# Altium schematic sheet Power.SchDoc
size A3
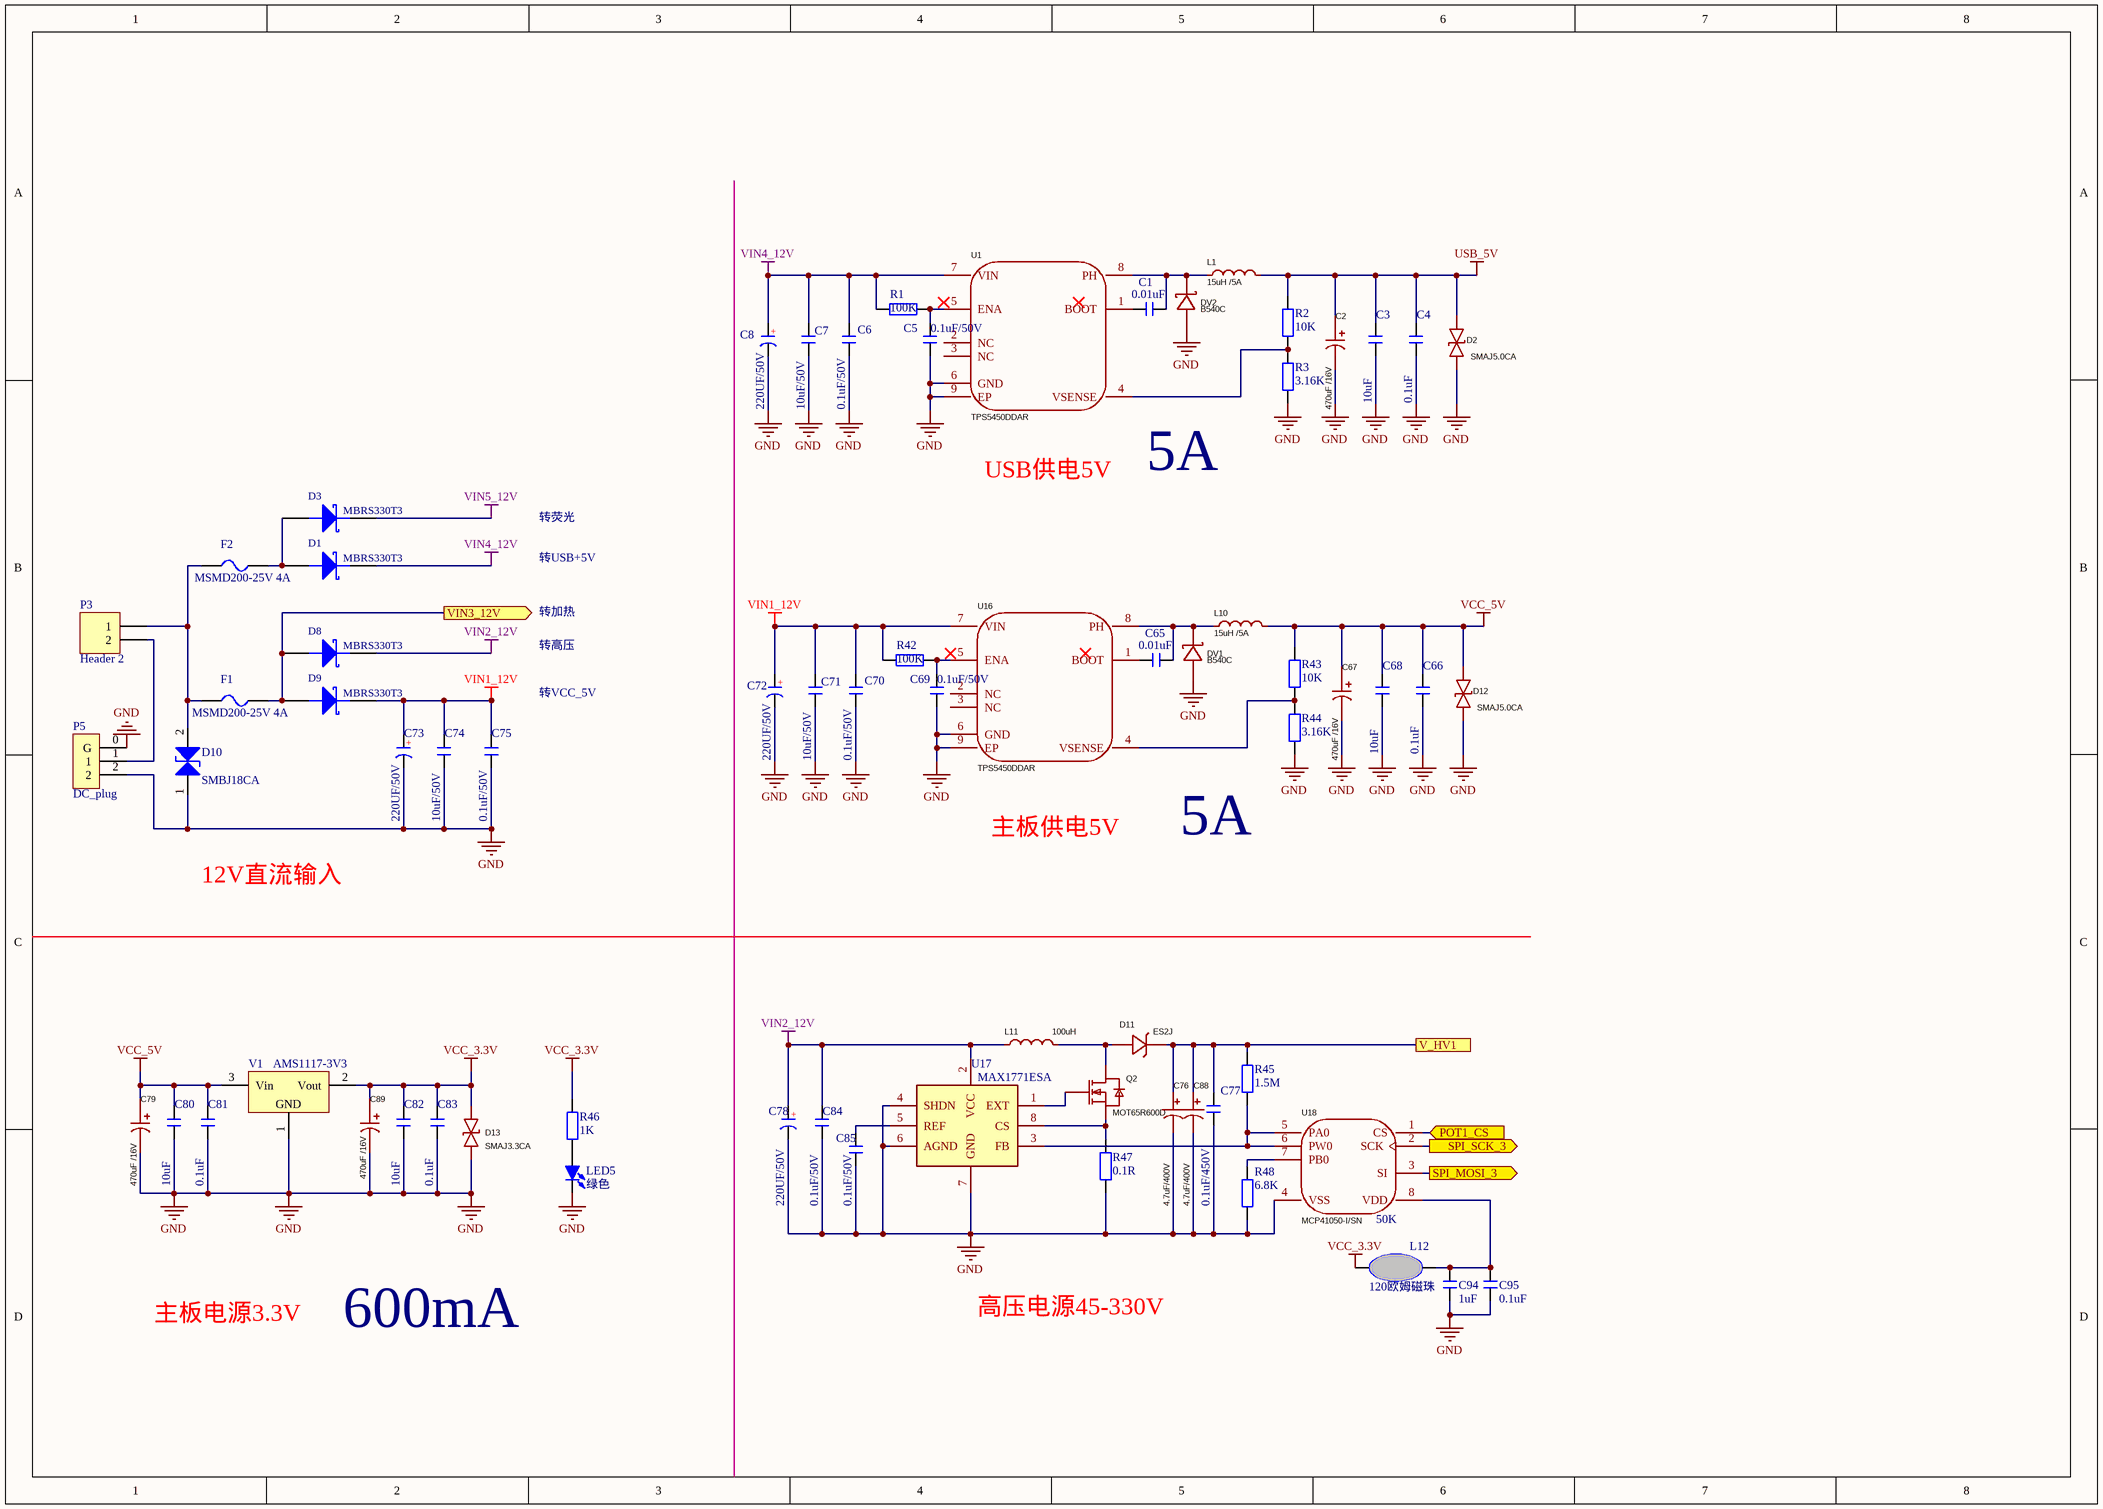
[diagram p0: Power.SchDoc]

## Parts
C1  0.01uF  [C 1206]
C2  470uF /16V  [CAP-TH_BD8.0-P3.50-D0.6-FD]
C3  10uF  [C 0805]
C4  0.1uF  [C 0603]
C5  0.1uF/50V  [C 1206]
C6  0.1uF/50V  [C 1206]
C7  10uF/50V  [C 1206]
C8  220UF/50V  [CAP 5.0*10*12.5]
C65  0.01uF  [C 1206]
C66  0.1uF  [C 0603]
C67  470uF /16V  [CAP-TH_BD8.0-P3.50-D0.6-FD]
C68  10uF  [C 0805]
C69  0.1uF/50V  [C 1206]
C70  0.1uF/50V  [C 1206]
C71  10uF/50V  [C 1206]
C72  220UF/50V  [CAP 5.0*10*12.5]
C73  220UF/50V  [CAP 5.0*10*12.5]
C74  10uF/50V  [C 1206]
C75  0.1uF/50V  [C 1206]
C76  4.7uF/400V  [CAP-TH_BD8.0-P3.50-D0.6-FD]
C77  0.1uF/450V  [C 1206]
C78  220UF/50V  [CAP 5.0*10*12.5]
C79  470uF /16V  [CAP-TH_BD8.0-P3.50-D0.6-FD]
C80  10uF  [C 0805]
C81  0.1uF  [C 0603]
C82  10uF  [C 0805]
C83  0.1uF  [C 0603]
C84  0.1uF/50V  [C 1206]
C85  0.1uF/50V  [C 1206]
C88  4.7uF/400V  [CAP-TH_BD8.0-P3.50-D0.6-FD]
C89  470uF /16V  [CAP-TH_BD8.0-P3.50-D0.6-FD]
C94  1uF  [C 0603]
C95  0.1uF  [C 0603]
D1  MBRS330T3  [MBRS340]
D2  SMAJ5.0CA  [SMA_L4.4-W2.6-LS5.0-BI]
D3  MBRS330T3  [MBRS340]
D8  MBRS330T3  [MBRS340]
D9  MBRS330T3  [MBRS340]
D10  SMBJ18CA  [SMB]
D11  ES2J  [SMB_L4.4-W3.6-LS5.4-RD]
D12  SMAJ5.0CA  [SMA_L4.4-W2.6-LS5.0-BI]
D13  SMAJ3.3CA  [SMA_L4.4-W2.6-LS5.0-BI]
DV1  B540C  [SMC_L7.1-W6.2-LS8.1-RD]
DV2  B540C  [SMC_L7.1-W6.2-LS8.1-RD]
F1  MSMD200-25V 4A  [FU 1812]
F2  MSMD200-25V 4A  [FU 1812]
L1  15uH /5A  [IND-SMD_L8.5-W8.0_PCC-M0854M]
L10  15uH /5A  [IND-SMD_L8.5-W8.0_PCC-M0854M]
L11  100uH  [IND-SMD_L18.3-W17.0]
L12  120欧姆磁珠  [L 0603]
LED5  绿色  [LED 0603G]
P3  Header 2  [SIP2-3.5mm]
P5  DC_plug  [POWERPLUG_slc]
Q2  MOT65R600D  [TO-252-3_L6.6-W6.1-P4.58-LS10.1-BR-1]
R1  100K  [R 0603]
R2  10K  [R 0603]
R3  3.16K  [R 0603]
R42  100K  [R 0603]
R43  10K  [R 0603]
R44  3.16K  [R 0603]
R45  1.5M  [RES-TH_BD2.4-L6.3-P10.30-D0.6]
R46  1K  [R 0603]
R47  0.1R  [R 1812]
R48  6.8K  [R 0603]
U1  TPS5450DDAR  [SOP-8_L4.9-W3.9-P1.27-LS6.0-BL-EP]
U16  TPS5450DDAR  [SOP-8_L4.9-W3.9-P1.27-LS6.0-BL-EP]
U17  MAX1771ESA  [SOP8_N]
U18  MCP41050-I/SN  [SOIC-8_L4.9-W3.9-P1.27-LS6.0-BL]
V1  AMS1117-3V3  [SOT223_M]

## Ports
POT1_CS (in), SPI_MOSI_3 (out), SPI_SCK_3 (out), V_HV1, VIN3_12V (out)

## Nets
GND: C2.2 C3.1 C4.1 C5.1 C6.1 C7.1 C8.2 C66.1 C67.2 C68.1 C69.1 C70.1 C71.1 C72.2 C73.2 C74.1 C75.1 C76.2 C77.1 C78.2 C79.2 C80.1 C81.1 C82.1 C83.1 C84.1 C85.1 C88.2 C89.2 C94.2 C95.2 D2.1 D10.1(A) D12.1 D13.1 DV1.2(A) DV2.2(A) LED5.2(K) P5.0(G) P5.2 R3.2 R44.2 R47.2 R48.2 U1.6(GND) U1.9(EP) U16.6(GND) U16.9(EP) U17.4(SHDN) U17.6(AGND) U17.7(GND) U18.4(VSS) V1.1(GND)
USB_5V: C2.1 C3.2 C4.2 D2.2 L1.2 R2.1
VCC_3.3V: C82.2 C83.2 C89.1 D13.2 L12.1 R46.2 V1.2(Vout)
VCC_5V: C66.2 C67.1 C68.2 C79.1 C80.2 C81.2 D12.2 L10.2 R43.1 V1.3(Vin)
VIN1_12V: C70.2 C71.2 C72.1 C73.1 C74.2 C75.2 D9.2(K) R42.2 U16.7(VIN)
VIN2_12V: C78.1 C84.2 D8.2(K) L11.1 U17.2(VCC)
VIN4_12V: C6.2 C7.2 C8.1 D1.2(K) R1.2 U1.7(VIN)
VIN5_12V: D3.2(K)
POT1_CS: U18.1(CS) ; port POT1_CS
SPI_MOSI_3: U18.3(SI) ; port SPI_MOSI_3
SPI_SCK_3: U18.2(SCK) ; port SPI_SCK_3
V_HV1: C76.1 C77.2 C88.1 D11.1(C) R45.1 ; port V_HV1
VIN3_12V: D8.1(A) D9.1(A) F1.2 ; port VIN3_12V
NetC1_1: C1.1 DV2.1(K) L1.1 U1.8(PH)
NetC1_2: C1.2 U1.1(BOOT)
NetC5_2: C5.2 R1.1 U1.5(ENA)
NetC65_1: C65.1 DV1.1(K) L10.1 U16.8(PH)
NetC65_2: C65.2 U16.1(BOOT)
NetC69_2: C69.2 R42.1 U16.5(ENA)
NetC85_2: C85.2 U17.5(REF)
NetC94_1: C94.1 C95.1 L12.2 U18.8(VDD)
NetD1_1: D1.1(A) D3.1(A) F2.2
NetD10_2: D10.2(K) F1.1 F2.1 P3.1
NetD11_2: D11.2(A) L11.2 Q2.2(D)
NetLED5_1: LED5.1(A) R46.1
NetP3_2: P3.2 P5.1
NetQ2_1: Q2.1(G) U17.1(EXT)
NetQ2_3: Q2.3(S) R47.1 U17.8(CS)
NetR2_2: R2.2 R3.1 U1.4(VSENSE)
NetR43_2: R43.2 R44.1 U16.4(VSENSE)
NetR45_2: R45.2 U17.3(FB) U18.5(PA0) U18.6(PW0)
NetR48_1: R48.1 U18.7(PB0)

Not connected (* = marked no-connect by the designer): U1 2(NC) 3(NC); U16 2(NC) 3(NC)

## Notes on the sheet
- USB供电5V
- (near U1) 5A
- 转USB+5V
- 转荧光
- 转高压
- 转加热
- 转VCC_5V
- 主板供电5V
- 5A
- 12V直流输入
- (near U18) 50K
- 主板电源3.3V
- 高压电源45-330V
- 600mA
- (in symbol C-CAP) +

## Library data of the parts
C1 C3-C7 C65 C66 C68-C71 C74 C75 C77 C80 C84 C85 = C: 无极性贴片电容; 版权归属: 源创客; BOM名称: 无极性贴片电容; 学习资源: www.ooocke.com
C2 C67 C79 C89 = JBLE2471M016D090RLM 470UF 16V: Add into BOM: yes; Rated Voltage: 16V; Ripple Current: 3.7A@100kHz; Symbol: JBLE2471M016D090RLM 470UF 16V; Device: JBLE2471M016D090RLM 470UF 16V; Supplier Part: C19270650; Manufacturer Part: JBLE2471M016D090RLM 470UF 16V; JLCPCB Part Class: Extended Part; Datasheet: https://atta.szlcsc.com/upload/public/pdf/source/20240115/1E5B34C3EFC94403EAAAB66897201DA6.pdf; Supplier: LCSC; Convert to PCB: yes; Value: 470uF
C8 C72 C73 C78 = C-CAP: 直插电解电容; 版权归属: 源创客; BOM名称: 直插电解电容; 学习资源: www.ooocke.com
C76 C88 = ERK2GM4R7F09OT: Add into BOM: yes; Value: 4.7uF; Rated Voltage: 400V; Ripple Current: 94mA@100kHz; L: 9mm; Symbol: ERK2GM4R7F09OT; Device: ERK2GM4R7F09OT; Supplier Part: C112499; Manufacturer Part: ERK2GM4R7F09OT; JLCPCB Part Class: Extended Part; Datasheet: https://atta.szlcsc.com/upload/public/pdf/source/20200117/C486002_277F2A16EBB2F90C92EEA28887F58F34.pdf; Supplier: LCSC; Convert to PCB: yes; Equivalent Series Resistance(ESR): -; Lead Spacing: 3.5mm
C81-C83 C94 C95 = C-CC: 直插瓷片电容; 版权归属: 源创客; BOM名称: 直插瓷片电容; 学习资源: www.ooocke.com
D1 D3 D8 D9 = DIODE SCHOTTKY: Schottky Diode
D2 D12 = SMAJ5.0CA_C83324: Symbol: SMAJ5.0CA-C83324; Add into BOM: yes; Reverse Stand-Off Voltage (Vrwm): 5V; Maximum Clamping Voltage: 9.2V; Peak Pulse Current (Ipp)@10/1000us: 43.5A; Peak Pulse Power Dissipation (Ppp)@10/1000us: 400W; Breakdown Voltage: 6.4V; Type: TVS; Device: SMAJ5.0CA_C83324; Supplier Part: C83324; Manufacturer Part: SMAJ5.0CA; Supplier Footprint: SMA(DO-214AC); JLCPCB Part Class: Extended Part; Datasheet: https://atta.szlcsc.com/upload/public/pdf/source/20190402/C374025_5ACE77BC72947DF13CF0CBC7F8B57228.pdf; Supplier: LCSC; Convert to PCB: yes
D10 = 1.04.03.0004: SMBJ36CA,DO-214AA,君耀,RoHS; 名称: TVS管; 贴片和直插: SMT; 器件优选方案: 样品物料,谨慎选用; 物料代码: 1.04.03.0004; Value: SMBJ36CA; 封装: SMB; 设备封装名称: SMB; 厂商: 君耀; RoHS: RoHS; 型号: SMBJ18CA; ComponentLink1Description: ErpDataInfo; ComponentLink1URL: http://erp.zlgmcu.com/ErpExt/ErpData/ListMateriel.aspx?pkey=1.04.03.0004
D11 = ES2J_C19078414: Add into BOM: yes; Forward Voltage (Vf@If): 1.65V@2A; Reverse Voltage (Vr): 600V; Rectified Current: 2A; Reverse Leakage Current (Ir): 5uA@600V; Reverse Recovery Time (trr): 35ns; Symbol: ES2J_C19078414; Device: ES2J_C19078414; LCSC Part Name: ES2J; Supplier Part: C19078414; Manufacturer Part: ES2J; Supplier Footprint: SMB; JLCPCB Part Class: Extended Part; Datasheet: https://atta.szlcsc.com/upload/public/pdf/source/20240112/F384E3D3354022DF52BCF808895A4B58.pdf; Supplier: LCSC; Convert to PCB: yes
D13 = SMAJ3.3CA_C2959732: Add into BOM: yes; Reverse Stand-Off Voltage (Vrwm): 3.3V; Maximum Clamping Voltage: 7.3V; Peak Pulse Current (Ipp)@10/1000us: 54.8A; Breakdown Voltage: 4.3V; Reverse Leakage Current (Ir): 200uA; Type: TVS; Symbol: SMAJ3.3CA_C2959732; Device: SMAJ3.3CA_C2959732; Supplier Part: C2959732; Manufacturer Part: SMAJ3.3CA; Supplier Footprint: DO-214AC(SMA); JLCPCB Part Class: Extended Part; Datasheet: https://atta.szlcsc.com/upload/public/pdf/source/20240321/7565B800065238EC693350450D0B602E.pdf; Supplier: LCSC; Convert to PCB: yes
DV1 DV2 = B540C-13-F: Add into BOM: yes; Forward Voltage (Vf@If): 550mV@5A; Reverse Voltage (Vr): 40V; Average Rectified Current (Io): 5A; Reverse Leakage Current (Ir): 500uA@40V; Symbol: B540C-13-F; Device: B540C-13-F; Supplier Part: C72264; Manufacturer Part: B540C-13-F; Supplier Footprint: SMC(DO-214AB); JLCPCB Part Class: Extended Part; Datasheet: https://atta.szlcsc.com/upload/public/pdf/source/20171023/C134461_15087453602301052556.pdf; Supplier: LCSC; Convert to PCB: yes
F1 F2 = FU: 贴片保险丝; 版权归属: 源创客; BOM名称: 贴片保险丝; 学习资源: www.ooocke.com
L1 L10 = PSPMAA0805-150M-ANP: Add into BOM: yes; Rated Current: 5A; Saturation Current (Isat): 9A; Symbol: PSPMAA0805-150M-ANP; Device: PSPMAA0805-150M-ANP; Supplier Part: C2962886; Manufacturer Part: PSPMAA0805-150M-ANP; Supplier Footprint: SMD,8x8.5mm; JLCPCB Part Class: Extended Part; Datasheet: https://atta.szlcsc.com/upload/public/pdf/source/20220120/BD7CDDF36FF1CD7AF8FF4A475B57DD20.pdf; Supplier: LCSC; Convert to PCB: yes; Value: 15uH; Ratings: AEC-Q200
L11 = YSPIA1770-101M: Add into BOM: yes; Rated Current: 3.5A; Saturation Current (Isat): 5A; Symbol: YSPIA1770-101M; Device: YSPIA1770-101M; Supplier Part: C2931812; Manufacturer Part: YSPIA1770-101M; Supplier Footprint: SMD,18.25x17mmx7mm; JLCPCB Part Class: Extended Part; Datasheet: https://atta.szlcsc.com/upload/public/pdf/source/20210615/C2839932_33EF3FE61893DB0D450802CD7C52B644.pdf; Supplier: LCSC; Convert to PCB: yes; Value: 100uH; Ratings: -
L12 = FERRITBEAD
LED5 = LED-SMD: 贴片LED; 版权归属: 源创客; BOM名称: 贴片LED; 学习资源: www.ooocke.com
P3 = Header 2: Header, 2-Pin; LatestRevisionDate: 17-Jul-2002; LatestRevisionNote: Re-released for DXP Platform.; Publisher: Altium Limited
Q2 = MOT65R600D: Add into BOM: yes; Drain Source Voltage (Vdss): 650V; Continuous Drain Current (Id): 7A; Power Dissipation (Pd): 63W; Gate Threshold Voltage (Vgs(th)@Id): 2.5V@250uA; Total Gate Charge (Qg@Vgs): 13nC@10V; Input Capacitance (Ciss@Vds): 509pF@100V; Reverse Transfer Capacitance (Crss@Vds): 1.5pF@100V; Symbol: MOT65R600D; Device: MOT65R600D; Supplier Part: C5143201; Manufacturer Part: MOT65R600D; Supplier Footprint: TO-252; JLCPCB Part Class: Extended Part; Datasheet: https://atta.szlcsc.com/upload/public/pdf/source/20231226/F31B09EB8E73CB4CBA914FBE4A0ABFD1.pdf; Supplier: LCSC; Convert to PCB: yes
R1-R3 R42-R48 = R: 贴片电阻; 版权归属: 源创客; BOM名称: 贴片电阻; 学习资源: www.ooocke.com
U1 U16 = TPS5450DDAR: Add into BOM: yes; Input Voltage: 5.5V~36V; Output Voltage: 1.221V~31.32V; Output Current: 5A; Switching Frequency: 500kHz; Number of Outputs: 1; Symbol: TPS5450DDAR; Device: TPS5450DDAR; Supplier Part: C114425; Manufacturer Part: TPS5450DDAR; Supplier Footprint: SOP-8-EP-150mil; JLCPCB Part Class: Extended Part; Datasheet: https://www.ti.com/cn/lit/gpn/tps5450; Supplier: LCSC; Convert to PCB: yes
U18 = MCP41050-I/SN: Add into BOM: yes; Number of Taps: 256; Number of Channels: 1; Supply Voltage: 2.7V~5.5V; Interface Type: SPI; Symbol: MCP41050-I/SN; Device: MCP41050-I/SN; LCSC Part Name: MCP41050-I/SN; Supplier Part: C124138; Manufacturer Part: MCP41050-I/SN; Supplier Footprint: SOIC-8; JLCPCB Part Class: Extended Part; Datasheet: https://atta.szlcsc.com/upload/public/pdf/source/20220205/C2666606_C5E8E7A5F3891B321C1555D845654E7B.pdf; Supplier: LCSC; Convert to PCB: yes
V1 = AMS1117: 三端稳压芯片; BOM名称: 稳压芯片; 版权归属: 源创客; 学习资源: www.ooocke.com